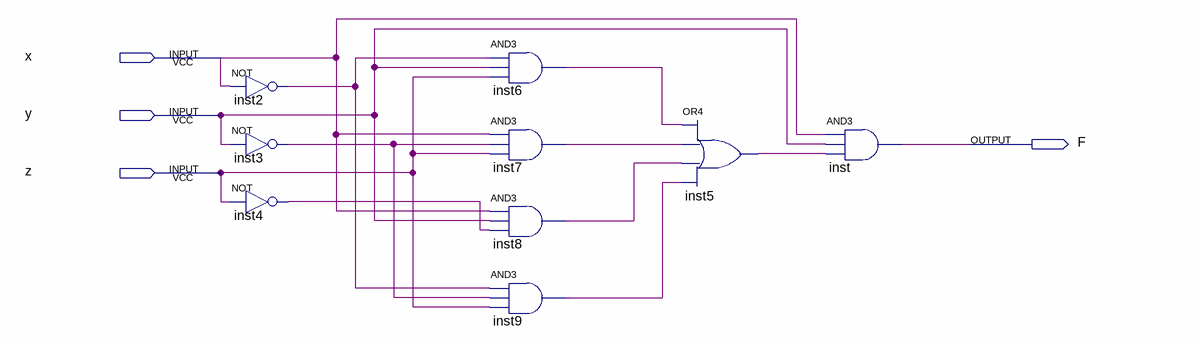
[diagram p0: schematic sheet]
// Quartus schematic problem2.bdf as structural Verilog: 9 symbols, 4 pins
module problem2 (
  input  x,
  input  y,
  input  z,
  output F
);

  wire inst2_out, inst3_out, inst4_out, inst5_out, inst6_out, inst7_out, inst8_out, inst9_out;

  not inst2 (inst2_out, x);
  not inst3 (inst3_out, y);
  not inst4 (inst4_out, z);
  and inst6 (inst6_out, inst2_out, y, z);
  and inst7 (inst7_out, x, inst3_out, z);
  and inst8 (inst8_out, x, y, inst4_out);
  and inst9 (inst9_out, inst2_out, inst3_out, z);
  or inst5 (inst5_out, inst6_out, inst7_out, inst8_out, inst9_out);
  and inst (F, x, y, inst5_out);
endmodule
